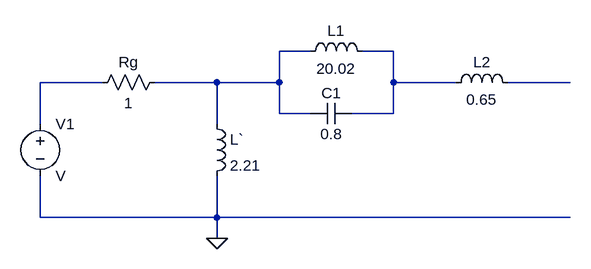
[diagram p0: schematic Ejercicio1A.asc]
Ejercicio1A.asc, the LTspice schematic file:
Version 4.1
SHEET 1 880 680
WIRE 448 -16 400 -16
WIRE 576 -16 528 -16
WIRE 128 32 32 32
WIRE 304 32 208 32
WIRE 400 32 400 -16
WIRE 400 32 304 32
WIRE 576 32 576 -16
WIRE 672 32 576 32
WIRE 848 32 752 32
WIRE 400 80 400 32
WIRE 448 80 400 80
WIRE 576 80 576 32
WIRE 576 80 512 80
WIRE 32 96 32 32
WIRE 304 96 304 32
WIRE 32 240 32 176
WIRE 304 240 304 176
WIRE 304 240 32 240
WIRE 848 240 304 240
WIRE 304 272 304 240
FLAG 304 272 0
SYMBOL voltage 32 80 R0
SYMATTR InstName V1
SYMBOL res 224 16 R90
WINDOW 0 0 56 VBottom 2
WINDOW 3 32 56 VTop 2
SYMATTR InstName Rg
SYMATTR Value 1
SYMBOL ind 288 80 R0
SYMATTR InstName L`
SYMATTR Value 2.21
SYMATTR SpiceLine Rser=1m
SYMBOL ind 432 0 R270
WINDOW 0 32 56 VTop 2
WINDOW 3 5 56 VBottom 2
SYMATTR InstName L1
SYMATTR Value 20.02
SYMATTR SpiceLine Rser=1m
SYMBOL cap 512 64 R90
WINDOW 0 0 32 VBottom 2
WINDOW 3 32 32 VTop 2
SYMATTR InstName C1
SYMATTR Value 0.8
SYMBOL ind 656 48 R270
WINDOW 0 32 56 VTop 2
WINDOW 3 5 56 VBottom 2
SYMATTR InstName L2
SYMATTR Value 0.65
SYMATTR SpiceLine Rser=1m

The netlist it stands for:
* Ejercicio1A.asc
V1 N003 0 V
Rg N001 N003 1
L` N001 0 2.21 Rser=1m
L1 N001 N002 20.02 Rser=1m
C1 N002 N001 0.8
L2 N002 N004 0.65 Rser=1m
.backanno
.end